# Altium schematic sheet I2C_Expander.SchDoc: I2C_Expander
size A3; Organization: Altium Limited; Address1: L3, 12a Rodborough Rd; Address2: Frenchs Forest; Address3: NSW; Address4: Australia 2086
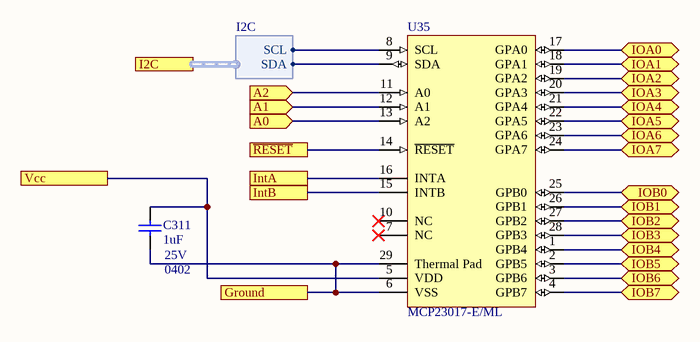
[diagram p0: I2C_Expander.SchDoc]

## Parts
C311  1uF  Case/Package: 0402  Voltage Rating: 25V  [CAP 0402/1005 KK]
U35  MCP23017-E/ML  [QFN-ML28_N]

## Ports
A0 (in), A1 (in), A2 (in), Ground, I2C (harness I2C), IntA, IntB, IOA0 (bidir), IOA1 (bidir), IOA2 (bidir), IOA3 (bidir), IOA4 (bidir), IOA5 (bidir), IOA6 (bidir), IOA7 (bidir), IOB0 (bidir), IOB1 (bidir), IOB2 (bidir), IOB3 (bidir), IOB4 (bidir), IOB5 (bidir), IOB6 (bidir), IOB7 (bidir), Vcc, ~{RESET}

## Harnesses
I2C: SCL, SDA

## Nets
A0: U35.13(A2) ; port A0
A1: U35.12(A1) ; port A1
A2: U35.11(A0) ; port A2
Ground: C311.1 U35.6(VSS) U35.29(Thermal_Pad) ; port Ground
IntA: U35.16(INTA) ; port IntA
IntB: U35.15(INTB) ; port IntB
IOA0: U35.17(GPA0) ; port IOA0
IOA1: U35.18(GPA1) ; port IOA1
IOA2: U35.19(GPA2) ; port IOA2
IOA3: U35.20(GPA3) ; port IOA3
IOA4: U35.21(GPA4) ; port IOA4
IOA5: U35.22(GPA5) ; port IOA5
IOA6: U35.23(GPA6) ; port IOA6
IOA7: U35.24(GPA7) ; port IOA7
IOB0: U35.25(GPB0) ; port IOB0
IOB1: U35.26(GPB1) ; port IOB1
IOB2: U35.27(GPB2) ; port IOB2
IOB3: U35.28(GPB3) ; port IOB3
IOB4: U35.1(GPB4) ; port IOB4
IOB5: U35.2(GPB5) ; port IOB5
IOB6: U35.3(GPB6) ; port IOB6
IOB7: U35.4(GPB7) ; port IOB7
~{RESET}: U35.14(~{RESET}) ; port ~{RESET}
Vcc: C311.2 U35.5(VDD) ; port Vcc
NetU35_8: U35.8(SCL) ; port I2C.SCL
NetU35_9: U35.9(SDA) ; port I2C.SDA

Not connected (* = marked no-connect by the designer): U35 7(NC)* 10(NC)*

## Notes on the sheet
- Title
- Size:
- Date:
- A3
- Number:
- Time:
- Revision:
- Sheet
- of
- File:

## Library data of the parts
C311 = Capacitor: MURATA - GRT155R61E105KE01D - SMD Multilayer Ceramic Capacitor, 1 µF, 25 V, 0402 [1005 Metric], ± 10%, X5R, GRT Series - SMD Multilayer Ceramic Capacitor, 1 µF, 25 V, 0402 [1005 Metric], ± 10%, X5R, GRT Series; Supplier 1: Digi-Key; Supplier Part Number 1: 490-12263-1-ND; Manufacturer: Murata; Manufacturer Part Number: GRT155R61E105KE01D; RoHS: Yes; Category: Ceramic Capacitors; Stock 1: 341453; Pricing 1: 1=0,18000, 10=0,12300, 100=0,06210, 500=0,04248, 1000=0,03758, 2500=0,03594, 5000=0,03268 (USD); Mount: Surface Mount; Case Code (Metric): 1005; Case Code (Imperial): 0402; Min Operating Temperature: -55°C; Max Operating Temperature: 85°C; Packaging: Tape and Reel; Capacitance: 1uF; Tolerance: 10%; Dielectric: X5R; Voltage Rating (DC): 25V; Length: 0.039inch; Width: 0.02inch; Thickness: 0.022inch; Ratings: AEC-Q200; ComponentLink1URL: http://www.farnell.com/datasheets/2165918.pdf?src-supplier=Farnell; ComponentLink1Description: http://www.farnell.com/datasheets/2165918.pdf?src-supplier=Farnell; ComponentLink2URL: http://search.murata.co.jp/Ceramy/image/img/A01X/G101/ENG/GRT155R61E105KE01-01.pdf?src-supplier=Digi-Key; ComponentLink2Description: http://search.murata.co.jp/Ceramy/image/img/A01X/G101/ENG/GRT155R61E105KE01-01.pdf?src-supplier=Digi-Key; ComponentLink3URL: http://www.farnell.com/datasheets/2165918.pdf?src-supplier=Element14; ComponentLink3Description: http://www.farnell.com/datasheets/2165918.pdf?src-supplier=Element14
U35 = MCP23017-E/ML: 16-Bit I/O Expander with Serial Interface, 28-Pin QFN, Extended Temperature; Manufacturer: Microchip; DatasheetVersion: revB, Feb-2007; PackageVersion: revBB, Aug-2009; PackageReference: QFN-ML28; PackageDescription: 28-Lead Plastic Quad Flat, No Lead Package (ML) - 6x6 mm Body [QFN] with 0.55 mm Contact Length; Supplier 1: Digi-Key; Supplier Part Number 1: MCP23017-E/ML-ND; Supplier 2: Newark; Supplier Part Number 2: 31K2957; Supplier 3: Mouser; Supplier Part Number 3: 579-MCP23017-E/ML; Mounting Technology: Surface Mount; Code_JEDEC: MO-220; PartNumber: MCP23017-E/ML; ComponentLink1Description: Manufacturer URL; ComponentLink1URL: http://www.microchip.com/; ComponentLink2Description: Datasheet; ComponentLink2URL: http://ww1.microchip.com/downloads/en/DeviceDoc/21952b.pdf; ComponentLink3Description: Package Specification; ComponentLink3URL: http://www.microchip.com/stellent/groups/techpub_sg/documents/packagingspec/en012702.pdf